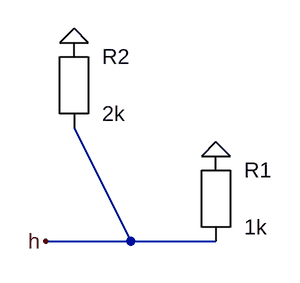
[diagram p0: schematic diagonal_end_on_wire_interior.asc]
diagonal_end_on_wire_interior.asc, the LTspice schematic file:
Version 4
SHEET 1 880 680
WIRE 0 192 192 192
WIRE 32 64 96 192
SYMBOL res 192 144 R0
SYMATTR InstName R1
SYMATTR Value 1k
SYMBOL res 32 16 R0
SYMATTR InstName R2
SYMATTR Value 2k
FLAG 192 96 0
FLAG 32 -32 0
FLAG 0 192 h

The netlist it stands for:
* diagonal_end_on_wire_interior.asc
R1 0 h 1k
R2 0 h 2k
.backanno
.end